# Altium schematic sheet Display.SchDoc
size A; SheetNumber: 5; SheetTotal: 8
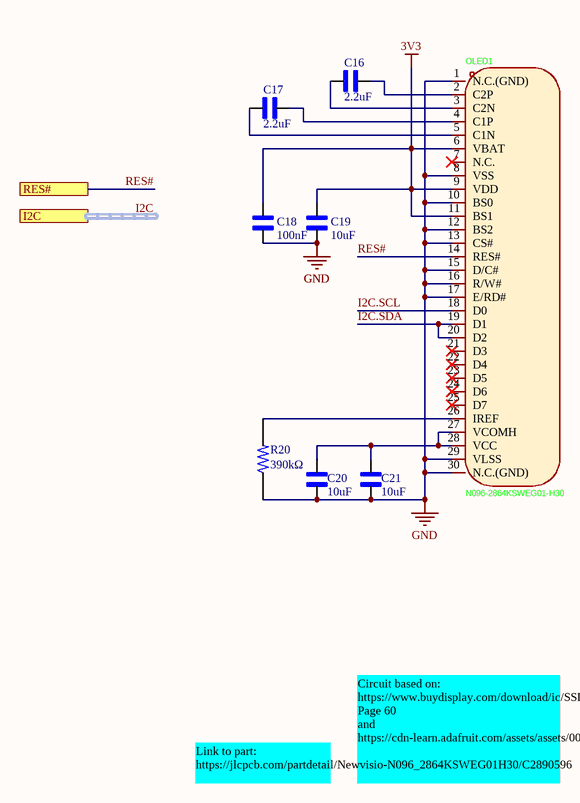
[diagram p0: Display.SchDoc]

## Parts
C16  value 2.2uF  [CAPC1608X90N]  (hidden comment: C0603C105K4RACTU)
C17  value 2.2uF  [CAPC1608X90N]  (hidden comment: C0603C105K4RACTU)
C18  value 100nF  [CAPC1608X90N]  (hidden comment: C0603C105K4RACTU)
C19  value 10uF  [CAPC1608X90N]  (hidden comment: C0603C105K4RACTU)
C20  value 10uF  [CAPC1608X90N]  (hidden comment: C0603C105K4RACTU)
C21  value 10uF  [CAPC1608X90N]  (hidden comment: C0603C105K4RACTU)
OLED1  N096-2864KSWEG01-H30  [OLED_0.96-30P-P0.70-12864]
R20  value 390kΩ  [RESC1607X60N]  (hidden comment: RC0603FR-07100KL)

## Ports
I2C (harness I2C, see STM32[1D]), RES# (see STM32[1D])

## Nets
3V3: C18.2 C19.2 OLED1.6(VBAT) OLED1.9(VDD) OLED1.11(BS1)
GND: C18.1 C19.1 C20.2 C21.2 OLED1.1(N.C.(GND)) OLED1.8(VSS) OLED1.10(BS0) OLED1.12(BS2) OLED1.13(CS#) OLED1.15(D/C#) OLED1.16(R/W#) OLED1.17(E/RD#) OLED1.29(VLSS) OLED1.30(N.C.(GND)) R20.1
I2C.SCL: OLED1.18(D0)
I2C.SDA: OLED1.19(D1) OLED1.20(D2)
RES#: OLED1.14(RES#) ; port RES#
NetC16_1: C16.1 OLED1.2(C2P)
NetC16_2: C16.2 OLED1.3(C2N)
NetC17_1: C17.1 OLED1.4(C1P)
NetC17_2: C17.2 OLED1.5(C1N)
NetC20_1: C20.1 C21.1 OLED1.27(VCOMH) OLED1.28(VCC)
NetOLED1_26: OLED1.26(IREF) R20.2

Not connected (* = marked no-connect by the designer): OLED1 7(N.C.)* 21(D3)* 22(D4)* 23(D5)* 24(D6)* 25(D7)*

## Buses and harness runs
harness I2C = port I2C

## Notes on the sheet
- Link to part:
  https://jlcpcb.com/partdetail/Newvisio-N096_2864KSWEG01H30/C2890596
- Circuit based on:
  https://www.buydisplay.com/download/ic/SSD1306.pdf
  Page 60
  and
  https://cdn-learn.adafruit.com/assets/assets/000/093/884/original/adafruit_products_0-96in_OLED_sch.png?1596746114

## Library data of the parts
OLED1 = N096-2864KSWEG01-H30: Manufacturer: Newvision(新智景); Add into BOM: yes; Main Control Chip: SSD1306; Symbol: N096-2864KSWEG01-H30; Device: N096-2864KSWEG01-H30; LCSC Part Name: 0.96寸 白色 128x64像素分辨率 单色 30PIN; Supplier Part: C2890596; Manufacturer Part: N096-2864KSWEG01-H30; Supplier Footprint: -; JLCPCB Part Class: Extended Part; Supplier: LCSC; Convert to PCB: yes; Size: 0.96
R20 = RC0603FR-07100KL: 100 kOhms Â±1% 0.1W, 1/10W Chip Resistor 0603 (1608 Metric) Moisture Resistant Thick Film; MF: Yageo; SnapEDA_Link: https://www.snapeda.com/parts/RC0603FR-07100KL/Yageo/view-part/?ref=snap; Package: 0603 Yageo; MP: RC0603FR-07100KL; Check_prices: https://www.snapeda.com/parts/RC0603FR-07100KL/Yageo/view-part/?ref=eda
C16-C21 = C0603C105K4RACTU: Package: None; Price: None; MP: C0603C105K4RACTU; Availability: Unavailable